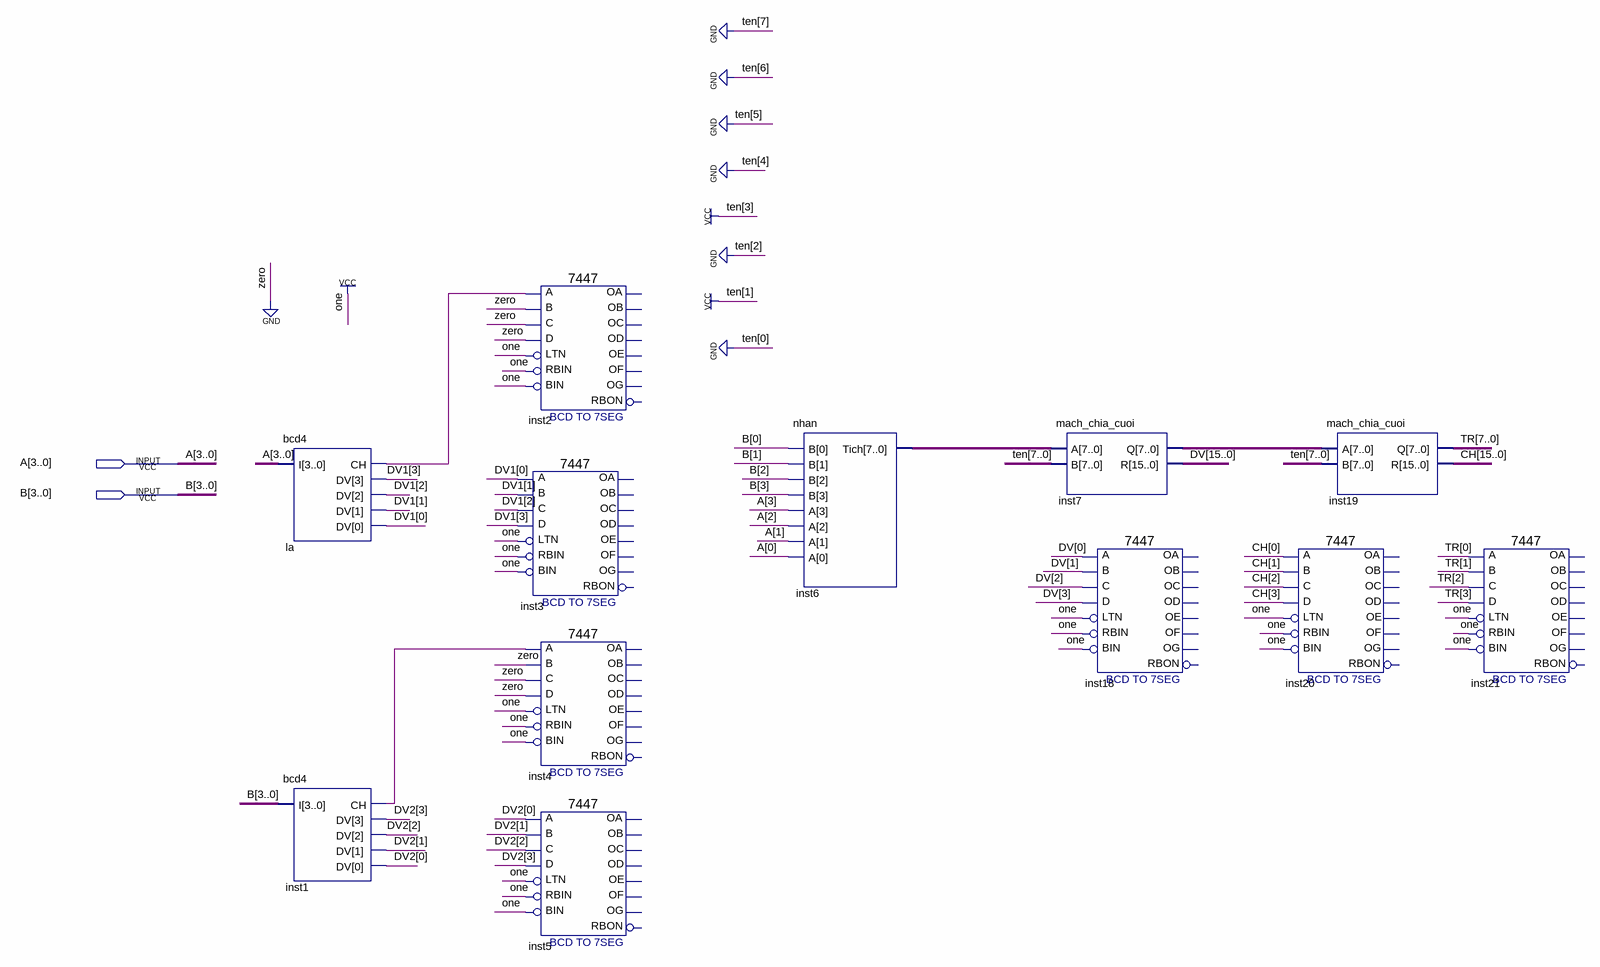
[diagram p0: schematic sheet]
// Quartus schematic hien_thi_led.bdf as structural Verilog: 12 symbols, 2 pins
module hien_thi_led (
  input  [3:0] A,
  input  [3:0] B
);

  wire inst1_ch, la_ch;
  wire [3:0] DV1, DV2;
  wire [7:0] inst6_tich, inst7_q, TR;
  wire [15:0] CH, DV;

  bcd4 la (.I(A), .CH(la_ch), .DV(DV1));
  bcd4 inst1 (.I(B), .CH(inst1_ch), .DV(DV2));
  \7447  inst2 (
    .LTN(1'b1), .B(1'b0), .C(1'b0), .D(1'b0), .RBIN(1'b1), .BIN(1'b1), .A(la_ch));  // open: OB, OC, OE, OD, OF, OG, OA, RBON
  \7447  inst3 (
    .LTN(1'b1), .B(DV1[1]), .C(DV1[2]), .D(DV1[3]), .RBIN(1'b1), .BIN(1'b1), .A(DV1[0]));  // open: OB, OC, OE, OD, OF, OG, OA, RBON
  \7447  inst4 (
    .LTN(1'b1), .B(1'b0), .C(1'b0), .D(1'b0), .RBIN(1'b1), .BIN(1'b1), .A(inst1_ch));  // open: OB, OC, OE, OD, OF, OG, OA, RBON
  \7447  inst5 (
    .LTN(1'b1), .B(DV2[1]), .C(DV2[2]), .D(DV2[3]), .RBIN(1'b1), .BIN(1'b1), .A(DV2[0]));  // open: OB, OC, OE, OD, OF, OG, OA, RBON
  nhan inst6 (.B(B), .A(A), .Tich(inst6_tich));
  mach_chia_cuoi inst7 (.A(inst6_tich), .B(8'b00001010), .Q(inst7_q), .R(DV));
  \7447  inst18 (
    .LTN(1'b1), .B(DV[1]), .C(DV[2]), .D(DV[3]), .RBIN(1'b1), .BIN(1'b1), .A(DV[0]));  // open: OB, OC, OE, OD, OF, OG, OA, RBON
  mach_chia_cuoi inst19 (.A(inst7_q), .B(8'b00001010), .Q(TR), .R(CH));
  \7447  inst20 (
    .LTN(1'b1), .B(CH[1]), .C(CH[2]), .D(CH[3]), .RBIN(1'b1), .BIN(1'b1), .A(CH[0]));  // open: OB, OC, OE, OD, OF, OG, OA, RBON
  \7447  inst21 (
    .LTN(1'b1), .B(TR[1]), .C(TR[2]), .D(TR[3]), .RBIN(1'b1), .BIN(1'b1), .A(TR[0]));  // open: OB, OC, OE, OD, OF, OG, OA, RBON
endmodule
